# Altium schematic sheet RFID_ANT.SchDoc
size A; SheetNumber: 4; SheetTotal: 4
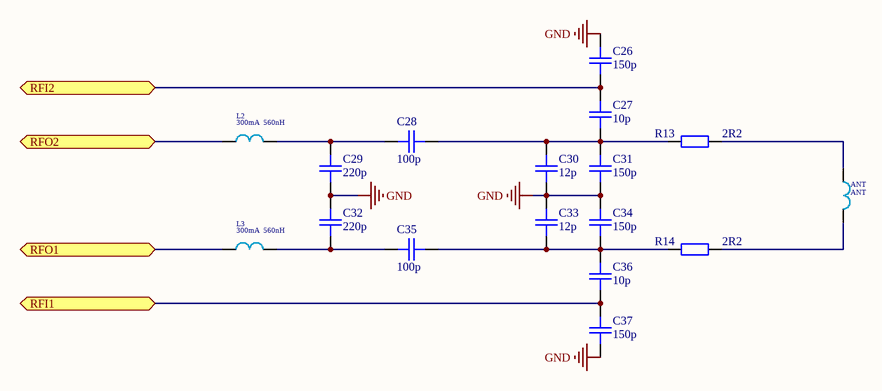
[diagram p0: RFID_ANT.SchDoc]

## Parts
ANT  ANT
C26  150p  [CAP_CERAMIC_0603(1608mm)]
C27  10p  [CAP_CERAMIC_0603(1608mm)]
C28  100p  [CAP_CERAMIC_0603(1608mm)]
C29  220p  [CAP_CERAMIC_0603(1608mm)]
C30  12p  [CAP_CERAMIC_0603(1608mm)]
C31  150p  [CAP_CERAMIC_0603(1608mm)]
C32  220p  [CAP_CERAMIC_0603(1608mm)]
C33  12p  [CAP_CERAMIC_0603(1608mm)]
C34  150p  [CAP_CERAMIC_0603(1608mm)]
C35  100p  [CAP_CERAMIC_0603(1608mm)]
C36  10p  [CAP_CERAMIC_0603(1608mm)]
C37  150p  [CAP_CERAMIC_0603(1608mm)]
L2  value 560nH  Imax: 300mA  (hidden comment: SDCL1608CR56)
L3  value 560nH  Imax: 300mA  (hidden comment: SDCL1608CR56)
R13  2R2  [RES_0603(1608)]
R14  2R2  [RES_0603(1608)]

## Ports
RFI1 (bidir, see STM32C0_ST25R100_EVK[3B], Sheet[1B]), RFI2 (bidir, see STM32C0_ST25R100_EVK[3B], Sheet[1B]), RFO1 (bidir, see STM32C0_ST25R100_EVK[3B], Sheet[1A]), RFO2 (bidir, see STM32C0_ST25R100_EVK[3B], Sheet[1A])

## Nets
GND: C26.2 C29.1 C30.1 C31.1 C32.2 C33.2 C34.2 C37.1
RFI1: C36.1 C37.2 ; port RFI1
RFI2: C26.1 C27.2 ; port RFI2
RFO1: L3.2 ; port RFO1
RFO2: L2.2 ; port RFO2
NetANT_1: ANT.1 R14.2
NetANT_2: ANT.2 R13.2
NetC27_1: C27.1 C28.1 C30.2 C31.2 R13.1
NetC28_2: C28.2 C29.2 L2.1
NetC32_1: C32.1 C35.2 L3.1
NetC33_1: C33.1 C34.1 C35.1 C36.2 R14.1

## Library data of the parts
ANT = L 0603 100n: Manufacturer: Shenzhen Sunlord Electronics Co., Ltd; Ind: 926nH; DCR: 1Ω; S.R.F.: 1400MHz; Package-mm: 1608; Tolerance %: ±5%; Q@100MHz: 65; Value: ANT; Temperature Range: -55°C ~ +125°C; TYPE: Inductors; Irms: *; Isat: *; Technology: Chip; Material: Ferrite; Published: *; Publisher: Hefest; Mount Type: SMT; ComponentLink1Description: Datasheet link; ComponentLink1URL: https://store.comet.bg/download-file.php?id=1927; RoHS: *; Manufacturer Alternate: *; Supplier 1: Comet; Supplier Part Number 1: *; Supplier 2: *; Supplier Part Number 2: *; Supplier 3: *; Supplier Part Number 3: *; Part Number Alternate: *; Price: *
C26 C27 C30 C33 C36 C37 = C0603: Capacitor Ceramic SMD 0603(1608); PackageReference: 0603
  C26 C37: Value: 150p
  C27 C36: Value: 10p
  C30 C33: Value: 12p
C28 C35 = C0603: Capacitor Ceramic SMD 0603(1608); Value: 47p; PackageReference: 0603
C29 C32 = C0603: Capacitor Ceramic SMD 0603(1608); Value: 270p; PackageReference: 0603
C31 C34 = C0603: Capacitor Ceramic SMD 0603(1608); Value: 130p; PackageReference: 0603
L2 L3 = L 0603 100n: SMD 0603   Multilayer High frequency Inductor   560 nH   100 mA   1 Ω Max   (Ex SDCL1608CR56JTDF...); PartNumber: SDCL1608CR56JTDF, SWEL1608CR56JT; Manufacturer: Shenzhen Sunlord Electronics Co., Ltd; TYPE: Inductors; DCR: 1Ω; Material: Ferrite; S.R.F.: 1400MHz; Package-mm: 1608; Tolerance %: ±5%; Q@100MHz: 65; Temperature Range: -55°C ~ +125°C; Ind: 560nH; Irms: *; Isat: *; Technology: Chip; Published: *; Publisher: Hefest; Mount Type: SMT; Package: 0603; ComponentLink1Description: Datasheet link; ComponentLink1URL: https://store.comet.bg/download-file.php?id=1927; RoHS: *; Manufacturer Alternate: *; Supplier 1: Comet; Supplier Part Number 1: *; Supplier 2: *; Supplier Part Number 2: *; Supplier 3: *; Supplier Part Number 3: *; Part Number Alternate: *; Price: *
R13 R14 = R0603: Resistor SMD 0603(1608); MPN: RC0603FR-070RL; Value: 2R2; Package: 0603